# EasyEDA Pro project ProPrj_RUSH_-_renumerado.epro

# Schematic Schematic1
Board Name: Board1; Create Date: 2026-11-04; Page Name: P1; Project Name: RUSH - corrigido; Schematic Name: Schematic1; Update Date: 2026-11-06; Company: EasyEDA.com; Drawn: Erick; Page Size: A4; Version: V1.0
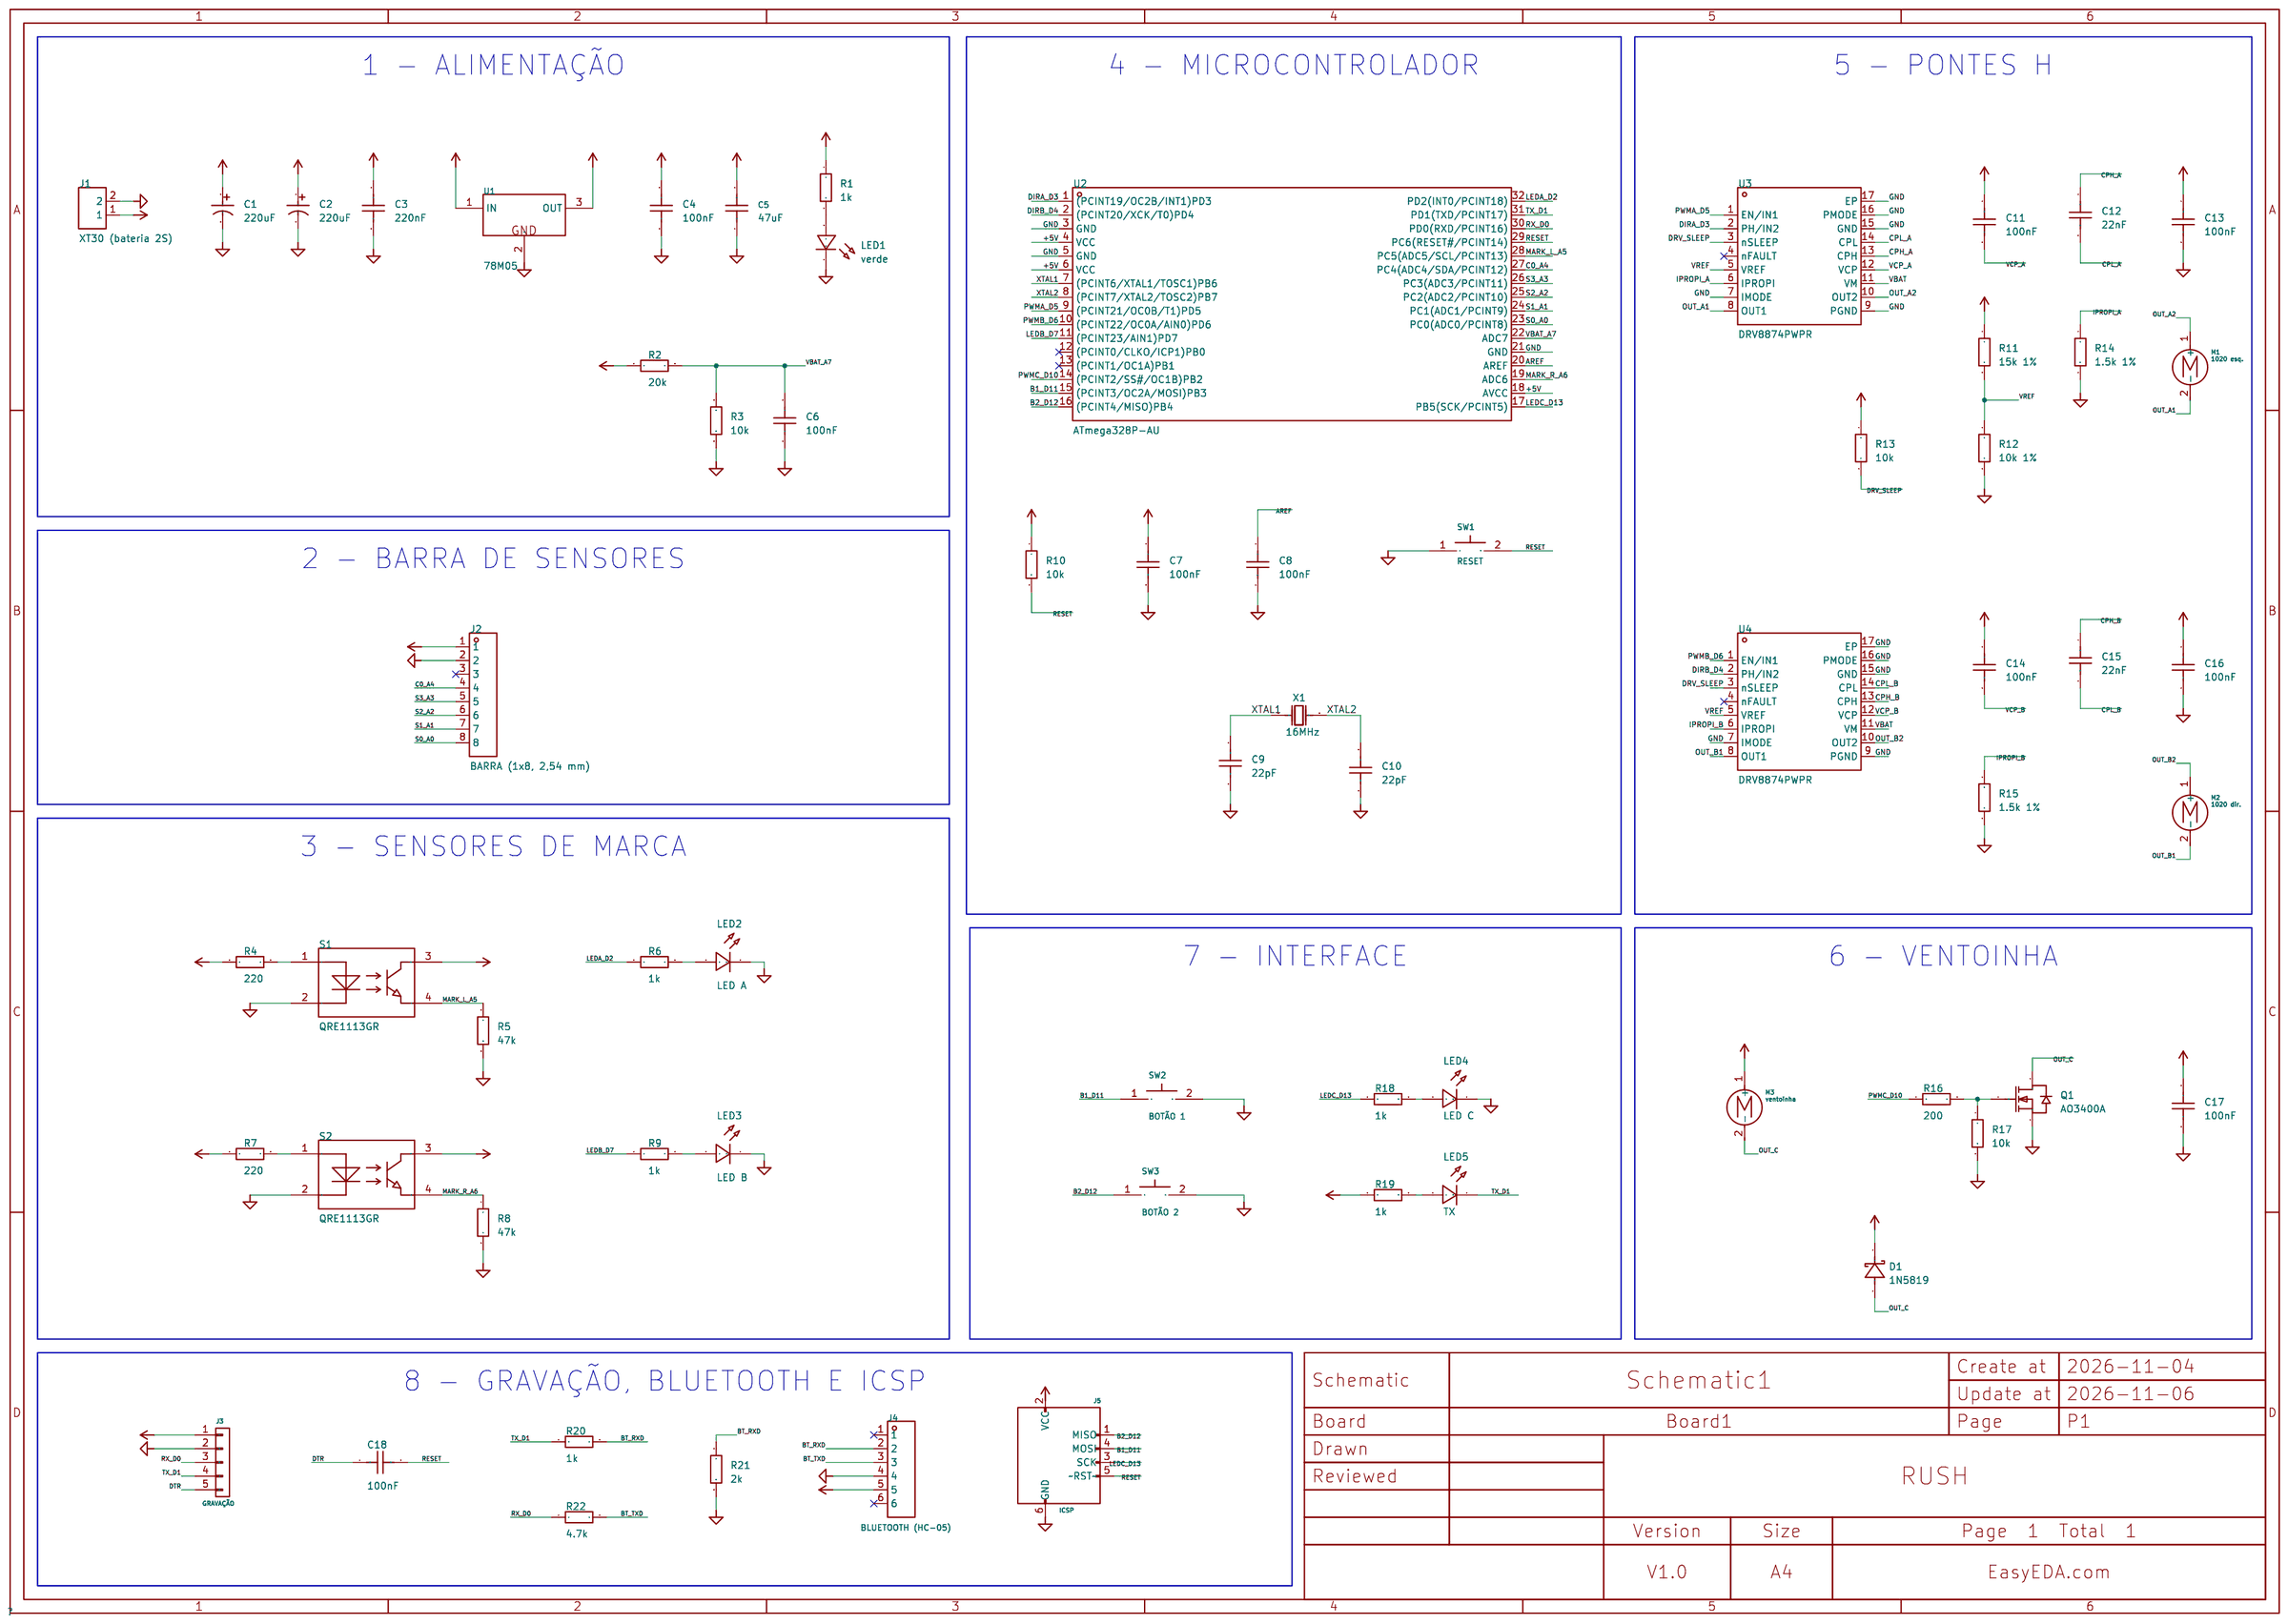
[diagram p0: schematic sheet]

## Parts
C1  220uF  [CAP-TH_BD6.3-P2.50-D1.0-FD]
C2  220uF  [CAP-TH_BD6.3-P2.50-D1.0-FD]
C3  220nF  [C0603]
C4  100nF  [C0603]
C5  47uF  [C1210]
C6  100nF  [C0603]
C7  100nF  [C0603]
C8  100nF  [C0603]
C9  22pF  [C0603]
C10  22pF  [C0603]
C11  100nF  [C0603]
C12  22nF  [C0603]
C13  100nF  [C0603]
C14  100nF  [C0603]
C15  22nF  [C0603]
C16  100nF  [C0603]
C17  100nF  [C0603]
C18  100nF  [C0603]
D1  1N5819  [SOD-123_L2.7-W1.6-LS3.7-RD-1]
J1  XT30 (bateria 2S)  [CONN-TH_XT30U-M]
J2  BARRA (1x8, 2,54 mm)  [HDR-TH_8P-P2.54-V-M]
J3  GRAVAÇÃO  [seguidor_alpha:HDR_1x05_P2.54_SMD_DEITADA]
J4  BLUETOOTH (femea 1x6, ordem HC-05)  [HDR-TH_6P-P2.54-V-F]
J5  ICSP  [seguidor_alpha:ICSP_6P_SMD_BOT]
LED1  verde  [LED0603-RD_GREEN]
LED2  LED A  [LED0603-RD_GREEN]
LED3  LED B  [LED0603-RD_GREEN]
LED4  LED C  [LED0603-RD_GREEN]
LED5  TX  [LED0603-RD_GREEN]
M1  1020 esq.  [seguidor_alpha:MOTOR_1020_2P]
M2  1020 dir.  [seguidor_alpha:MOTOR_1020_2P]
M3  ventoinha  [seguidor_alpha:MOTOR_1020_2P]
Q1  AO3400A  [SOT-23-3_L2.9-W1.3-P1.90-LS2.4-BR]
R1  1k  [R0603]
R2  20k 1%  [R0603]
R3  10k 1%  [R0603]
R4  220  [R0603]
R5  47k  [R0603]
R6  1k  [R0603]
R7  220  [R0603]
R8  47k  [R0603]
R9  1k  [R0603]
R10  10k  [R0603]
R11  15k 1%  [R0603]
R12  10k 1%  [R0603]
R13  10k  [R0603]
R14  1.5k 1%  [R0603]
R15  1.5k 1%  [R0603]
R16  200  [R0603]
R17  10k  [R0603]
R18  1k  [R0603]
R19  1k  [R0603]
R20  1k  [R0603]
R21  2k  [R0603]
R22  4.7k  [R0603]
S1  QRE1113GR  [OPTO-SMD_QRE1113GR]
S2  QRE1113GR  [OPTO-SMD_QRE1113GR]
SW1  RESET  [SW-SMD_L3.5-W6.0-P8.20]
SW2  BOTAO 1  [SW-SMD_L3.5-W6.0-P8.20]
SW3  BOTAO 2  [SW-SMD_L3.5-W6.0-P8.20]
U1  78M05  [TO-252-2_L6.5-W6.1-P4.58-LS10.0-TL]
U2  ATmega328P-AU  [TQFP-32_L7.0-W7.0-P0.80-LS9.0-BL]
U3  DRV8874PWPR  [HTSSOP-16_L5.0-W4.4-P0.65-LS6.4-BL-EP]
U4  DRV8874PWPR  [HTSSOP-16_L5.0-W4.4-P0.65-LS6.4-BL-EP]
X1  16MHz  [CRYSTAL-SMD_L5.0-W3.2]

## Library data of the parts
C1 C2 = KM221M025E110A: entre os pes da carcaca, como no EVA-RT; LCSC Part Name: 220uF ±20% 25V; Supplier Part: C59416; Manufacturer: CapXon(丰宾); Supplier Footprint: 插件,D6.3xL11mm; JLCPCB Part Class: Extended Part; Datasheet: https://item.szlcsc.com/datasheet/KM221M025E110A/60469.html; Supplier: LCSC; Tolerance: ±20%; Voltage Rating: 25V; Ripple Current: 235mA@120Hz; Pin Spacing: 2.5mm; Diameter: 6.3mm; Height - Seated (Max): 11mm; Lifetime: 2000hrs@105℃; Operating Temperature: -40℃~+105℃; Polarity type: Polarized; Encapsulamento: eletrolitico 25 V, radial D6,3 mm P2,5; DNP: no
C3 = CAP_0603: Supplier Footprint: 0603; Encapsulamento: 0603 50 V; DNP: no; Voltage Rating: 50V
C4 C9 C10 = CAP_0603: Supplier Footprint: 0603; Encapsulamento: 0603; DNP: no; Voltage Rating: 16V
C5 = GRM32ER61A476KE20L: Capacitance:47uF Tolerance:±10% Tolerance:±10% Voltage Rating:10V Temperature Coefficient:X5R; LCSC Part Name: 47uF ±10% 10V; Supplier Part: C397312; Manufacturer: muRata(村田); Supplier Footprint: 1210; JLCPCB Part Class: Extended Part; Datasheet: https://item.szlcsc.com/datasheet/GRM32ER61A476KE20L/378872.html; Supplier: LCSC; Tolerance: ±10%; Voltage Rating: 10V; Temperature Coefficient: X5R
C6 = CAP_0603: filtro da medicao (opcional); Supplier Footprint: 0603; Encapsulamento: 0603; DNP: no; Voltage Rating: 16V
C7 = CAP_0603: junto aos pinos VCC; Supplier Footprint: 0603; Encapsulamento: 0603; DNP: no; Voltage Rating: 16V
C8 = CAP_0603: AREF (referencia = AVCC no firmware); Supplier Footprint: 0603; Encapsulamento: 0603; DNP: no; Voltage Rating: 16V
C11 C14 = CAP_0603: VCP -> VM; Supplier Footprint: 0603; Encapsulamento: 0603 16 V X7R; DNP: no; Voltage Rating: 16V
C12 C15 = CAP_0603: CPH -> CPL (tensao >= VM); Supplier Footprint: 0603; Encapsulamento: 0603 50 V X7R; DNP: no; Voltage Rating: 50V
C13 C16 = CAP_0603: VM, junto ao pino 11; Supplier Footprint: 0603; Encapsulamento: 0603 25 V X7R; DNP: no; Voltage Rating: 25V
C17 = CAP_0603: Supplier Footprint: 0603; Encapsulamento: 0603 25 V; DNP: no; Voltage Rating: 25V
C18 = CAP_0603: reset automatico pelo DTR; Supplier Footprint: 0603; Encapsulamento: 0603; DNP: no; Voltage Rating: 16V
D1 = 1N5819HW: diodo de roda livre (novo; o EVA-RT nao tem); LCSC Part Name: 电压:40V 电流:1A; Supplier Part: C2905649; Manufacturer: TECH PUBLIC(台舟); Supplier Footprint: SOD-123; JLCPCB Part Class: Extended Part; Datasheet: https://item.szlcsc.com/datasheet/1N5819HW/3175946.html; Supplier: LCSC; Voltage - Forward(Vf@If): 900mV@3A; Voltage - DC Reverse(Vr): 40V; Current - Rectified: 1A; Reverse Leakage Current (Ir): 1mA@40V; Non-Repetitive Peak Forward Surge Current: 9A; Encapsulamento: SOD-123 (B5819W) ou 1N5819 nos terminais do motor; DNP: no
J1 = XT30U-M.G.B: pino 1 = +, pino 2 = -; LCSC Part Name: AMASS(艾迈斯)模插头锂电池插头电机控制器充电器电池接头连接器焊接 2芯锂电插头 黑色 公头15AXT30U-M.G.B; Supplier Part: C19268020; Manufacturer: AMASS(艾迈斯); JLCPCB Part Class: Extended Part; Datasheet: https://item.szlcsc.com/datasheet/XT30U-M.G.B/20526031.html; Supplier: LCSC; Encapsulamento: XT30PW-M de placa ou rabicho XT30; DNP: no
J2 = 2.54-1*8: Pin Structure:1x8P Pitch:2.54mm Circluar Pins/Square Pins:Pin Header Mounting Type:Through Hole Number of Rows:1 Number of Pins:8P Current Rating:2.5A Length of Mating Pin:6mm Insulation Height:2.54mm Length of End Connection Pin:3mm Contact Material:Bras; LCSC Part Name: 1x8P 间距:2.54mm 方针 直插; Supplier Part: C5156616; Manufacturer: ZHOURI(洲日); Supplier Footprint: 插件,P=2.54mm; JLCPCB Part Class: Extended Part; Datasheet: https://item.szlcsc.com/datasheet/2.54-1*8/5790716.html; Supplier: LCSC; Pin Structure: 1x8P; Pitch: 2.54mm; Circluar Pins/Square Pins: Pin Header; Mounting Type: Through Hole; Number of Rows: 1; Number of Pins: 8P; Current Rating: 2.5A; Length of Mating Pin: 6mm; Insulation Height: 2.54mm; Length of End Connection Pin: 3mm; Contact Material: Brass; Contact Plating: Gold; Operating Temperature: -40℃~+105℃; Encapsulamento: barra de pinos 1x8 2,54 mm; DNP: no
J3 = Connector_Generic_Conn_01x05: 1=+5V, 2=GND, 3=RX_D0, 4=TX_D1, 5=DTR. Face inferior no layout.; Encapsulamento: 5 pads SMD, passo 2,54 mm; montagem na face inferior; DNP: no
J4 = 2.54-1*6P母: frente direita, x = 32,5; HC-06 nas vias 2-5 (virado); LCSC Part Name: 1x6P 间距:2.54mm 直插; Supplier Part: C40877; Manufacturer: BOOMELE(博穆精密); Supplier Footprint: 插件,P=2.54mm; JLCPCB Part Class: Extended Part; Datasheet: https://item.szlcsc.com/datasheet/2.54-1*6P%25E6%25AF%258D/41861.html; Supplier: LCSC; Holes Structure: 1x6P; Pitch: 2.54mm; Circular Hole / Square Hole: Square Hole; Mounting Type: Through Hole; Number of Rows: 1; Number of Positions: 6P; Current Rating: 3A; Holes Direction: Top; Insulation Height: 8.5mm; Contact Material: Brass; Contact Plating: Gold; Operating Temperature: -40℃~+105℃; PIN Length: 3.2mm; Encapsulamento: barra femea 1x6 2,54 mm; DNP: no
J5 = Connector_AVR-ISP-6: posicoes do EVA-RT: x 33,97/36,51; y -8,36/-10,90/-13,44; Encapsulamento: 6 pads SMD D1,8 em grade 2,54; DNP: no
LED1 = LED_0603-G: indica 5 V presente; Encapsulamento: 0603; DNP: no
LED2 LED3 LED5 = LED_0603-G: Encapsulamento: 0603; DNP: no
LED4 = LED_0603-G: vermelho; o LED3 em paralelo do EVA-RT foi retirado; Encapsulamento: 0603; DNP: no
M1 M2 = Motor_Motor_DC: coreless 1020 7,4 V; se girar ao contrario, inverta os fios; Encapsulamento: 2 pads; DNP: no
M3 = Motor_Motor_DC: coreless 1020 7,4 V; Encapsulamento: 2 pads; DNP: no
Q1 = AO3400A_C20917: no lugar do IRFR3411/RM10N100LD; liga totalmente com 5 V no gate; LCSC Part Name: N沟道 耐压:30V; Supplier Part: C20917; Manufacturer: AOS; Supplier Footprint: SOT-23; JLCPCB Part Class: Basic Part; Datasheet: https://item.szlcsc.com/datasheet/AO3400A/21629.html; Supplier: LCSC; Number: 1 N-channel; Drain to Source Voltage: 30V; Current - Continuous Drain(Id): 5.7A; RDS(on): 48mΩ@2.5V; Pd - Power Dissipation: 1.4W; Gate Threshold Voltage (Vgs(th)): 1.45V; Gate Charge(Qg): 7nC@10V; Input Capacitance(Ciss): 630pF; Reverse Transfer Capacitance (Crss@Vds): 50pF; Operating Temperature: -55℃~+150℃; Type: N-Channel; Output Capacitance(Coss): 75pF; Vgs: ±12V; Encapsulamento: SOT-23 (1 = G, 2 = S, 3 = D); DNP: no
R1 R4-R9 R18 R19 = Res_0603: Supplier Footprint: 0603; Encapsulamento: 0603; DNP: no
R2 R3 = Res_0603: medicao da bateria (opcional); Supplier Footprint: 0603; Encapsulamento: 0603; DNP: no
R10 = Res_0603: EVA-RT usava 1k; 10k com reset automatico por DTR; Supplier Footprint: 0603; Encapsulamento: 0603; DNP: no
R11 R12 = Res_0603: VREF = 2,0 V; Supplier Footprint: 0603; Encapsulamento: 0603; DNP: no
R13 = Res_0603: nSLEEP sempre alto (pull-down interno de 100k); Supplier Footprint: 0603; Encapsulamento: 0603; DNP: no
R14 R15 = Res_0603: IPROPI -> limite de corrente; Supplier Footprint: 0603; Encapsulamento: 0603; DNP: no
R16 = Res_0603: gate; Supplier Footprint: 0603; Encapsulamento: 0603; DNP: no
R17 = Res_0603: gate -> GND (desligado no boot); Supplier Footprint: 0603; Encapsulamento: 0603; DNP: no
R20 R21 = Res_0603: divisor 5 V -> 3,3 V; Supplier Footprint: 0603; Encapsulamento: 0603; DNP: no
R22 = Res_0603: 4,7k: grava com o HC-05 encaixado (sem LED de RX); Supplier Footprint: 0603; Encapsulamento: 0603; DNP: no
S1 S2 = QRE1113GR: datasheet: 1 = anodo, 2 = catodo, 3 = coletor, 4 = emissor; LCSC Part Name: 微型反射式物体传感器; Supplier Part: C232862; Manufacturer: onsemi(安森美); Supplier Footprint: SMD-4P; JLCPCB Part Class: Extended Part; Datasheet: https://item.szlcsc.com/datasheet/QRE1113GR/232660.html; Supplier: LCSC; Sensing Distance: 1mm; Voltage - Forward(Vf): 1.2V; C-E Saturation Voltage: 30V; Current - Collector(Ic): 20mA; Reverse Pressure (Typ): 5V; Forward Current(If): 50mA; Wavelength: 940nm; Output Type: Phototransistor; Vce Saturation(VCE(sat)): 0.3V@If=20mA,Ic=50uA; Rise time: 20us@Vcc=5V,Ic=100uA,Rl=1kΩ; Fall time: 20us@Vcc=5V,Ic=100uA,Rl=1kΩ; Power Dissipation(Pd): 50mW; Operating Temperature: -40℃~+85℃; Encapsulamento: SMD 4 pinos; DNP: no
SW1-SW3 = 1TS002B-2500-4300-CT: Circuit:SPST Actuator Style:Rectangular Button Operating Force:2.5N Mounting Type:Surface Mount,Vertical Length:6mm Width:3.5mm Switch Height:4.3mm with Bracket:Without Bracket Contact Current:50mA Voltage Rating:12V Actuator/Cap Color:White With Lamp:No; LCSC Part Name: 6*3.5*4.3mm 立贴 轻触开关; Supplier Part: C255788; Manufacturer: HYP(鸿源精密); Supplier Footprint: SMD,6x3.5mm; JLCPCB Part Class: Extended Part; Datasheet: https://item.szlcsc.com/datasheet/1TS002B-2500-4300-CT/249831.html; Supplier: LCSC; Circuit: SPST; Actuator Style: Rectangular Button; Operating Force: 2.5N; Mounting Type: Surface Mount,Vertical; Length: 6mm; Width: 3.5mm; Switch Height: 4.3mm; with Bracket: Without Bracket; Contact Current: 50mA; Voltage Rating: 12V; Actuator/Cap Color: White; With Lamp: No; Termination Style: Gull Wing; Life: 30,000 Cycles; Operating Temperature: -40℃~+90℃; Encapsulamento: botao tatil 2 pinos (furo) ou B3U-1000P; DNP: no
U1 = 78M05_C111265: Output Configuration:Positive Voltage - Supply:35V Output Voltage:5V Output Voltage:5V Output Current:500mA Power Supply Rejection Ratio (PSRR):78dB@(120Hz) Voltage Dropout:2V@(500mA) standby current:6mA Noise:- Features:- Operating Temperature:-40℃~+125℃; LCSC Part Name: 5V 500mA 35V; Supplier Part: C111265; Manufacturer: SHIKUES(时科); Supplier Footprint: TO-252-2(DPAK); JLCPCB Part Class: Extended Part; Datasheet: https://item.szlcsc.com/datasheet/78M05/112491.html; Supplier: LCSC; Output Configuration: Positive; Voltage - Supply: 35V; Output Voltage: 5V; Output Current: 500mA; Power Supply Rejection Ratio (PSRR): 78dB@(120Hz); Voltage Dropout: 2V@(500mA); standby current: 6mA; Operating Temperature: -40℃~+125℃; Output Type: Fixed; Number of Outputs: 1; Encapsulamento: TO-252 (DPAK); DNP: no
U2 = ATMEGA328P-AU_C14877: do Nano/Uno doador (com bootloader) ou novo + bootloader pelo ICSP; LCSC Part Name: 基于AVR增强型RISC架构的低功耗CMOS 8位微控制器; Supplier Part: C14877; Manufacturer: MICROCHIP(美国微芯); Manufacturer Part: ATMEGA328P-AU; Supplier Footprint: TQFP-32(7x7); JLCPCB Part Class: Extended Part; Datasheet: https://item.szlcsc.com/datasheet/ATMEGA328P-AU/15549.html; Supplier: LCSC; CPU Core: AVR; CPU Maximum Speed: 20MHz; Core Size: 8 Bit; Program Storage Size: 32KB; Program Memory Type: FLASH; RAM Size: 2KB; EEPROM: 1KB; Number of I/O: 23; ADC (Bit): 10bit; Oscillator Type: Built-in; Voltage - Supply: 1.8V~5.5V; Operating Temperature: -40℃~+85℃; Features: External pin reset (NRST)；Built-in general-purpose timer；Power-on reset (POR)；Touch function；Undervoltage detection (BOR/LVD/LVR/LVI)；Programmable watchdog; Encapsulamento: TQFP-32; DNP: no
U3 = DRV8874PWPR: esq.; LCSC Part Name: 6A 有刷直流电机驱动芯片 4.5V~37V; Supplier Part: C1855818; Manufacturer: TI(德州仪器); Supplier Footprint: HTSSOP-16-EP; JLCPCB Part Class: Extended Part; Datasheet: https://www.ti.com/cn/lit/ds/symlink/drv8874.pdf; Supplier: LCSC; Technology: Yes; Number of H-bridges: 1; Peak Current: 6A; RDS(on): 200mΩ; Quiescent Current(Iq): 750nA; Operating Temperature: -40℃~+125℃; Features: Interleaved conduction protection；Current sensing/regulation function; Encapsulamento: HTSSOP-16 (PWP), pad termico com vias; DNP: no
U4 = DRV8874PWPR: dir.; LCSC Part Name: 6A 有刷直流电机驱动芯片 4.5V~37V; Supplier Part: C1855818; Manufacturer: TI(德州仪器); Supplier Footprint: HTSSOP-16-EP; JLCPCB Part Class: Extended Part; Datasheet: https://www.ti.com/cn/lit/ds/symlink/drv8874.pdf; Supplier: LCSC; Technology: Yes; Number of H-bridges: 1; Peak Current: 6A; RDS(on): 200mΩ; Quiescent Current(Iq): 750nA; Operating Temperature: -40℃~+125℃; Features: Interleaved conduction protection；Current sensing/regulation function; Encapsulamento: HTSSOP-16 (PWP), pad termico com vias; DNP: no
X1 = 7A-16.000MAAJ-T: Frequency:16MHz Normal temperature Frequency Tolerance:±30ppm Normal temperature Frequency Tolerance:±30ppm Load Capacitor: Frequency Stability(Full temperature range):±30ppm Frequency Stability(Full temperature range):±30ppm Equivalent Series Resistance; LCSC Part Name: 16MHz ±30ppm 18pF; Supplier Part: C2450102; Manufacturer: TXC(晶技); Supplier Footprint: SMD5032; JLCPCB Part Class: Extended Part; Datasheet: https://atta.szlcsc.com/upload/public/pdf/source/20180326/C97724_C4EFF7A16D0E132C961AD7AA14FCEEAA.pdf; Supplier: LCSC; Normal temperature Frequency Tolerance: ±30ppm; Frequency Stability(Full temperature range): ±30ppm; Equivalent Series Resistance (ESR): 50Ω

## Nets
+5V: C4.1 C5.2 C7.1 J2.1 J3.1(Pin) J4.5 J5.2(VCC) R1.1 R4.1 R7.1 R10.1 R11.1 R13.1 R19.1 S1.3(C) S2.3(C) U1.3(OUT) U2.4(VCC) U2.6(VCC) U2.18(AVCC)
GND: C1.2 C2.2 C3.2 C4.2 C5.1 C6.2 C7.2 C8.2 C9.2 C10.2 C13.2 C16.2 C17.2 J1.2 J2.2 J3.2(Pin) J4.4 J5.6(GND) LED1.1(C) LED2.1(C) LED3.1(C) LED4.1(C) Q1.2(S) R3.2 R5.2 R8.2 R12.2 R14.2 R15.2 R17.2 R21.2 S1.2 S2.2 SW1.1(A) SW2.2(B) SW3.2(B) U1.2(GND) U2.3(GND) U2.5(GND) U2.21(GND) U3.7(IMODE) U3.9(PGND) U3.15(GND) U3.16(PMODE) U3.17(EP) U4.7(IMODE) U4.9(PGND) U4.15(GND) U4.16(PMODE) U4.17(EP)
VBAT: C1.1 C2.1 C3.1 C11.1 C13.1 C14.1 C16.1 C17.1 D1.1(K) J1.1 M3.1(+) R2.1 U1.1(IN) U3.11(VM) U4.11(VM)
VBAT_A7: C6.1 R2.2 R3.1 U2.22(ADC7)
AREF: C8.1 U2.20(AREF)
B1_D11: J5.4(MOSI) SW2.1(A) U2.15((PCINT3/OC2A/MOSI)PB3)
B2_D12: J5.1(MISO) SW3.1(A) U2.16((PCINT4/MISO)PB4)
BT_RXD: J4.2 R20.2 R21.1
BT_TXD: J4.3 R22.2
C0_A4: J2.4 U2.27(PC4(ADC4/SDA/PCINT12))
CPH_A: C12.1 U3.13(CPH)
CPH_B: C15.1 U4.13(CPH)
CPL_A: C12.2 U3.14(CPL)
CPL_B: C15.2 U4.14(CPL)
DIRA_D3: U2.1((PCINT19/OC2B/INT1)PD3) U3.2(PH/IN2)
DIRB_D4: U2.2((PCINT20/XCK/T0)PD4) U4.2(PH/IN2)
DRV_SLEEP: R13.2 U3.3(nSLEEP) U4.3(nSLEEP)
DTR: C18.1 J3.5(Pin)
IPROPI_A: R14.1 U3.6(IPROPI)
IPROPI_B: R15.1 U4.6(IPROPI)
LEDA_D2: R6.1 U2.32(PD2(INT0/PCINT18))
LEDB_D7: R9.1 U2.11((PCINT23/AIN1)PD7)
LEDC_D13: J5.3(SCK) R18.1 U2.17(PB5(SCK/PCINT5))
MARK_L_A5: R5.1 S1.4(E) U2.28(PC5(ADC5/SCL/PCINT13))
MARK_R_A6: R8.1 S2.4(E) U2.19(ADC6)
OUT_A1: M1.2(-) U3.8(OUT1)
OUT_A2: M1.1(+) U3.10(OUT2)
OUT_B1: M2.2(-) U4.8(OUT1)
OUT_B2: M2.1(+) U4.10(OUT2)
OUT_C: D1.2(A) M3.2(-) Q1.3(D)
PWMA_D5: U2.9((PCINT21/OC0B/T1)PD5) U3.1(EN/IN1)
PWMB_D6: U2.10((PCINT22/OC0A/AIN0)PD6) U4.1(EN/IN1)
PWMC_D10: R16.1 U2.14((PCINT2/SS#/OC1B)PB2)
RESET: C18.2 J5.5(~RST~) R10.2 SW1.2(B) U2.29(PC6(RESET#/PCINT14))
RX_D0: J3.3(Pin) R22.1 U2.30(PD0(RXD/PCINT16))
S0_A0: J2.8 U2.23(PC0(ADC0/PCINT8))
S1_A1: J2.7 U2.24(PC1(ADC1/PCINT9))
S2_A2: J2.6 U2.25(PC2(ADC2/PCINT10))
S3_A3: J2.5 U2.26(PC3(ADC3/PCINT11))
TX_D1: J3.4(Pin) LED5.1(C) R20.1 U2.31(PD1(TXD/PCINT17))
VCP_A: C11.2 U3.12(VCP)
VCP_B: C14.2 U4.12(VCP)
VREF: R11.2 R12.1 U3.5(VREF) U4.5(VREF)
XTAL1: C9.1 U2.7((PCINT6/XTAL1/TOSC1)PB6) X1.1(OSC1)
XTAL2: C10.1 U2.8((PCINT7/XTAL2/TOSC2)PB7) X1.2(OSC2)
Net-(LED1-2): LED1.2(A) R1.2
Net-(LED2-2): LED2.2(A) R6.2
Net-(LED3-2): LED3.2(A) R9.2
Net-(LED4-2): LED4.2(A) R18.2
Net-(LED5-2): LED5.2(A) R19.2
Net-(Q1-1): Q1.1(G) R16.2 R17.1
Net-(R4-2): R4.2 S1.1
Net-(R7-2): R7.2 S2.1

Not connected (* = marked no-connect by the designer): J2 3*; J4 1* 6*; U2 12((PCINT0/CLKO/ICP1)PB0)* 13((PCINT1/OC1A)PB1)*; U3 4(nFAULT)*; U4 4(nFAULT)*

## Notes on the sheet
- 1 - ALIMENTAÇÃO
- 4 - MICROCONTROLADOR
- 5 - PONTES H
- 2 - BARRA DE SENSORES
- 3 - SENSORES DE MARCA
- 7 - INTERFACE
- 6 - VENTOINHA
- 8 - GRAVAÇÃO, BLUETOOTH E ICSP
